# EasyEDA Pro project ESP32S3_DMX_RDM_2026-06-09.epro, board PCB_3
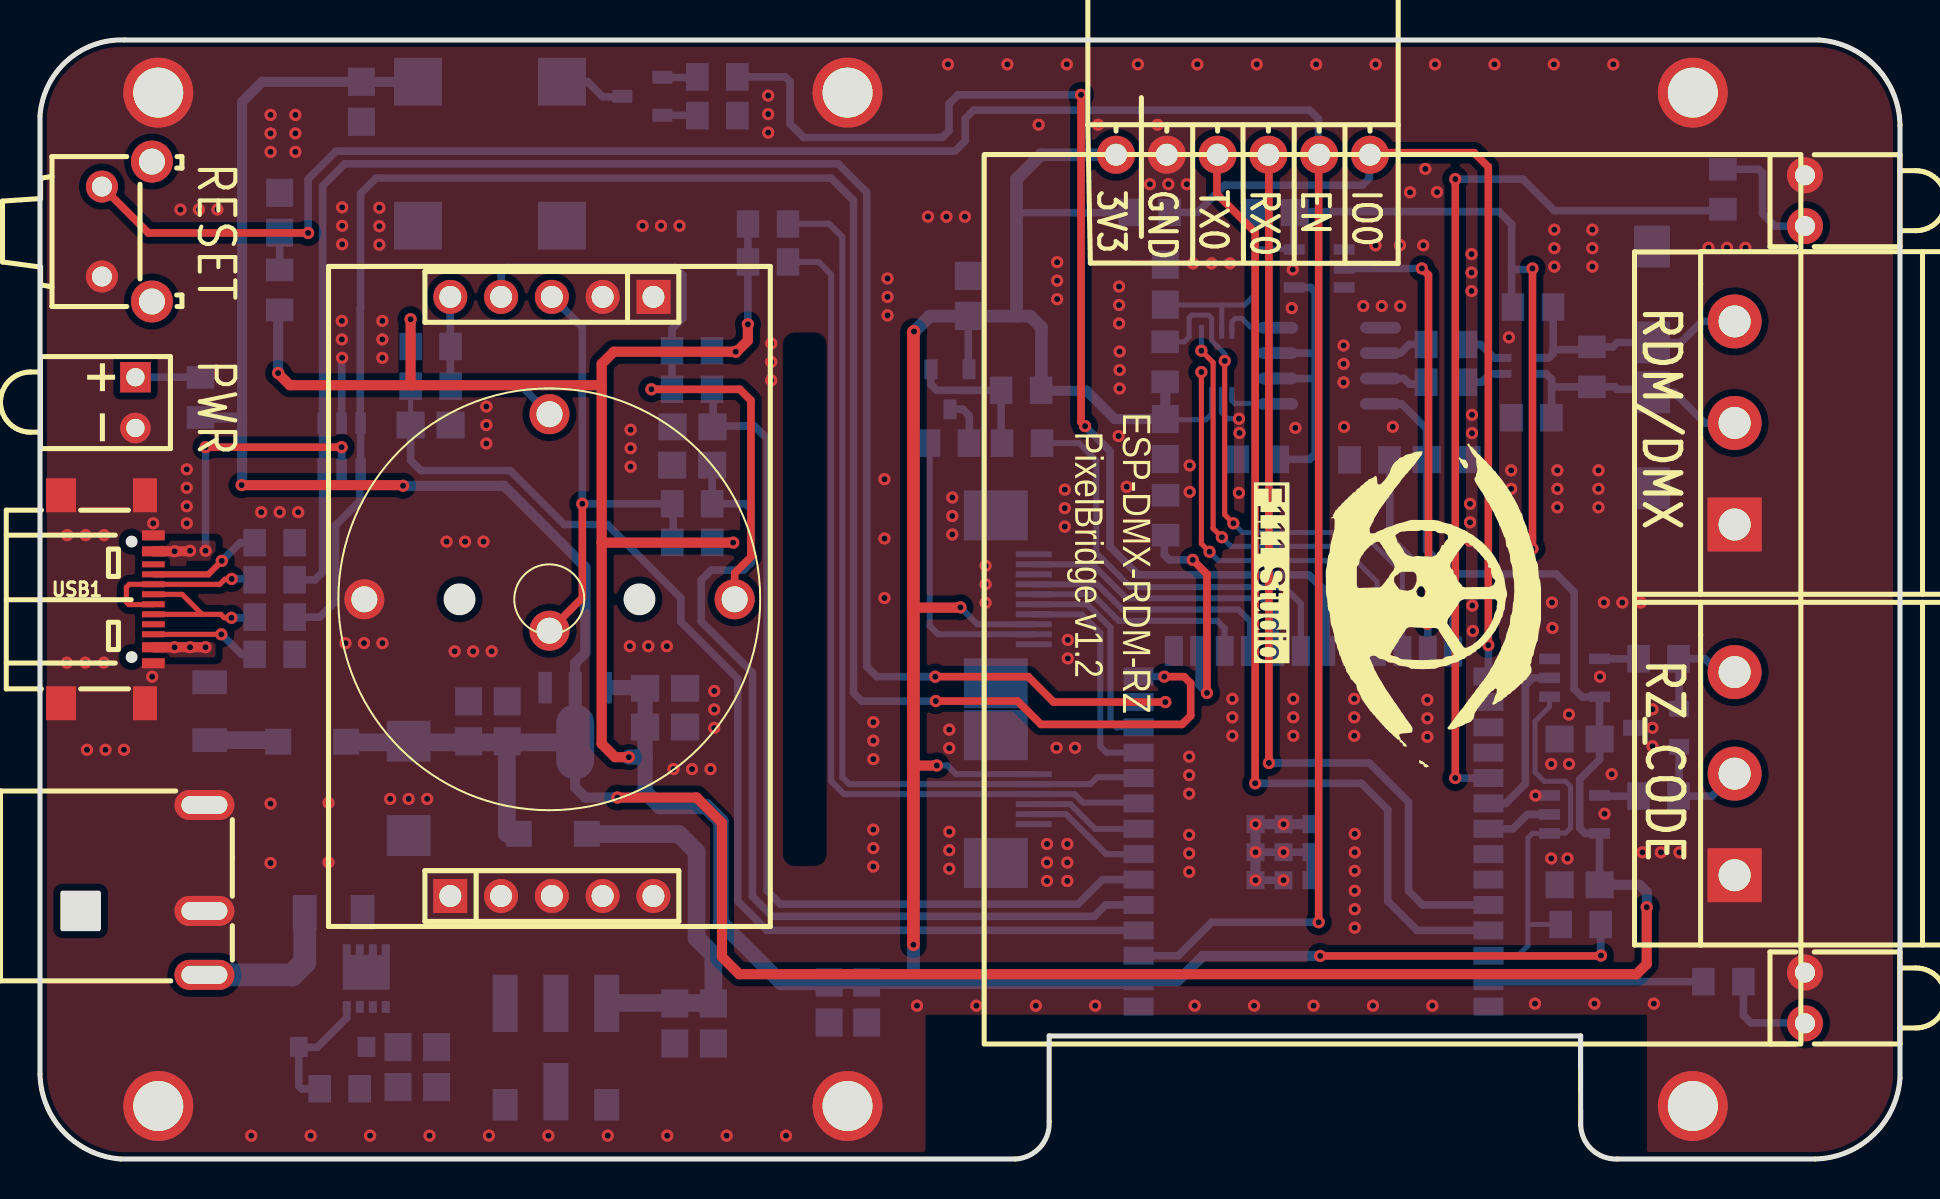
[diagram p17: board, top side]
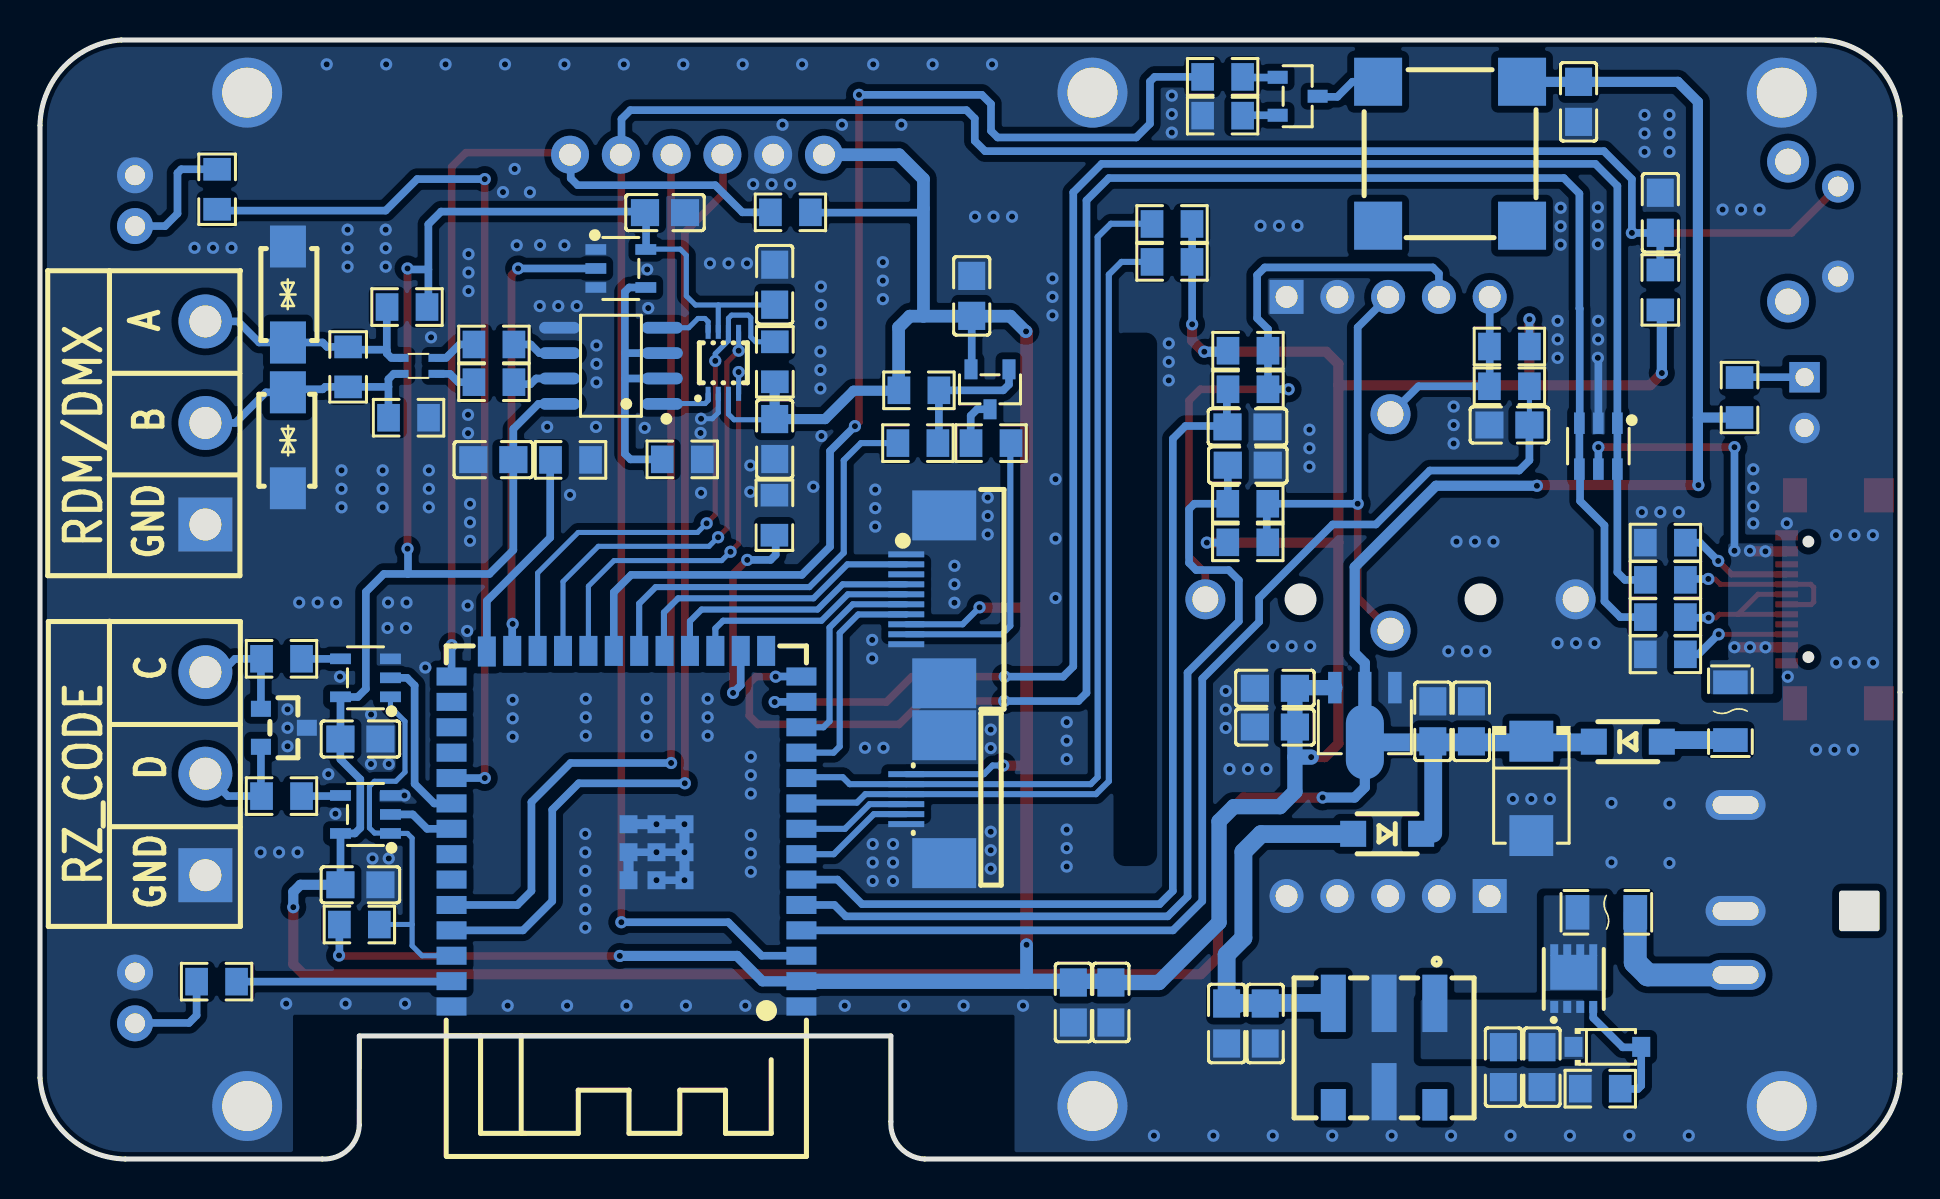
[diagram p18: board, bottom side, seen from below]

Outline 93.03 x 55.98 mm; copper layers: Top Layer, Bottom Layer. Coordinates in mm from the lower left corner of the outline.
Outline path: 0,52.17 0,23.35 0,4.27 arc(1.2,1.34) 4.06,0 48.79,0 arc(50.02,0.59) 50.48,1.87 50.48,6.16 77.06,6.16 77.06,1.69 arc(77.63,0.46) 78.91,0 88.76,0 arc(91.69,1.2) 93.03,4.06 93.03,51.71 arc(91.84,54.64) 88.97,55.98 4.22,55.98 arc(1.34,54.93) 0,52.17
Stack: Top Layer 0.035mm / Dielectric1 1.51mm FR4 er 4.5 / Bottom Layer 0.035mm

## Design rules (mm)
spacing copperThickness1oz (default): track to track 0.102, other pairs 0.152 to 0.3
spacing copperThickness2oz: track to track 0.203, other pairs 0.152 to 0.3
track width copperThickness1oz: min 0.127, default 0.254, max 2.54
track width copperThickness2oz (default): min 0.203, default 0.381, max 2.54
differential pair differentialPair (default): width min 0.127, default 0.254, max 2.54; gap min 0.152, default 0.152
net VBUS uses copperRegion2_copperThickness1oz
net GND uses copperRegion2_copperThickness1oz
pour e93 uses copperRegion2_default, default
net $2N68 uses copperRegion2_copperThickness1oz
net $2N66 uses copperRegion2_copperThickness1oz
net $1N437 uses copperRegion2_copperThickness1oz

## Placement (name value [footprint] x y rotation side)
C1  100nF  [C0805]  21.44 21.89 270 bottom
C2  22uF  [C0805]  23.37 21.89 270 bottom
C3  100nF  [C0805]  56.29 43.74 90 bottom
C4  100nF  [C0805]  61.77 47.35 0 bottom
C5  100nF  [C0805]  70.36 34.99 180 bottom
C6  100nF  [C0805]  41.35 7.83 90 bottom
C7  100nF  [C0805]  31.27 23.55 180 bottom
C8  100nF  [C0805]  56.29 36.02 90 bottom
C10  22uF  [C0805]  31.27 21.61 180 bottom
C11  10uF  [C0805]  39.47 7.83 90 bottom
C12  100nF  [C0805]  11.99 47.34 270 bottom
C13  100nF  [C0805]  77.01 13.72 0 bottom
C14  100nF  [C0805]  77.01 21.01 0 bottom
C20  10nF  [C0805]  32.64 36.63 0 bottom
C21  10nF  [C0805]  32.62 34.71 0 bottom
C22  10nF  [C0805]  19.54 36.72 180 bottom
C25  100nF  [C0805]  19.84 4.6 90 bottom
C26  10uF  [C0805]  17.91 4.6 270 bottom
C27  100nF  [C0805]  31.75 6.78 90 bottom
C28  22uF  [C0805]  33.68 6.78 90 bottom
C29  100nF  [C0805]  16.08 52.89 90 bottom
C32  22uF  [C0805]  46.43 43.18 270 bottom
CN1  WJ2EDGRC-5.08-03P-14-00A  [CONN-TH_3P-P5.08_WJ2EDGRC-5.08-3P]  84.76 19.28 90 top
CN2  WJ2EDGRC-5.08-03P-14-00A  [CONN-TH_3P-P5.08_WJ2EDGRC-5.08-3P]  84.76 36.82 90 top
D1  PESD5V0S2BT,215  [SOT-23_L2.9-W1.3-P1.90-LS2.4-BR]  80.83 21.57 0 bottom
D2  USBLC6-2SC6  [SOT-23-6_L2.9-W1.6-P0.95-LS2.8-BL]  15.09 35.66 0 bottom
D7  PMEG2020EH,115  [SOD-123FL_L2.6-W1.6-LS3.4-R-FD]  25.65 16.27 180 bottom
D8  PMEG2020EH,115  [SOD-123FL_L2.6-W1.6-LS3.4-R-FD]  13.61 20.88 0 bottom
D9  BZT52C15Q  [SOD-123_L2.6-W1.7-LS3.5-RD]  14.64 5.61 180 bottom
DC2  DC044  [DC-IN-TH_DC044]  8.22 13.46 0 top
F1  1206L050/36NR  [F1206]  8.48 22.4 90 bottom
F2  1206L050/36NR  [F1206]  14.69 12.34 0 bottom
FPC1  05B20L06P  [FPC-SMD_6P-P0.50_05B20L06P]  48.76 18 270 bottom
J1  -  [AN-P1S-2SP-Z]  34.75 28 180 top
L1  ACM2012-900-2P-T002  [IND-SMD_4P-L2.0-W1.2-TL]  74.1 39.68 0 bottom
LED2  MHK1375CGBTD  [LED-TH_MHK1375CGBTD]  88.28 8.06 90 top
LED3  MHK1375CGBTD  [LED-TH_MHK1375CGBTD]  88.28 47.94 90 top
LED4  MHK1375CRBTD  [LED-TH_MHK1375CRBTD]  4.77 37.84 270 top
NOREF  -  [Pad_e365]  40.39 2.65 0 top
NOREF#2  -  [Pad_e379]  82.67 2.65 0 top
NOREF#3  -  [Pad_e378]  82.67 53.35 0 top
NOREF#4  -  [Pad_e295]  5.92 2.65 0 top
NOREF#5  -  [Pad_e294]  40.39 53.35 0 top
NOREF#6  -  [Pad_e380]  5.92 53.35 0 top
Q4  HSBB6115  [DFN-8_L3.0-W3.0-P0.65-BL-1]  16.32 9.03 180 bottom
Q5  S8050  [SOT-23-3_L2.9-W1.3-P1.90-LS2.4-BR]  30.13 53.17 0 bottom
Q6  AO3401A  [SOT-23-3_L2.9-W1.3-P1.90-LS2.4-BR]  45.52 38.51 90 bottom
R1  10kΩ  [R0805]  11.99 43.48 270 bottom
R2  10kΩ  [R0805]  55.5 47.36 180 bottom
R4  5.1kΩ  [R0805]  11.73 30.84 0 bottom
R5  5.1kΩ  [R0805]  11.73 25.25 0 bottom
R6  1kΩ  [R0805]  8.03 38.09 270 bottom
R7  470Ω  [R0805]  84.18 48.51 270 bottom
R8  470Ω  [R0805]  84.2 8.87 180 bottom
R9  0Ω  [R0805]  70.33 40.75 180 bottom
R10  0Ω  [R0805]  70.33 38.86 180 bottom
R11  33R  [R0805]  80.95 18.16 180 bottom
R12  120R  [R0805]  77.62 39.63 270 bottom
R13  33R  [R0805]  80.95 25.02 180 bottom
R14  10kΩ  [R0805]  77.06 11.73 0 bottom
R15  10kΩ  [R0805]  60.91 35 180 bottom
R16  10kΩ  [R0805]  56.28 39.88 270 bottom
R17  1kΩ  [R0805]  74.6 37.08 180 bottom
R18  1kΩ  [R0805]  74.68 42.62 0 bottom
R20  0Ω  [R0805]  11.73 28.97 0 bottom
R21  100Ω  [R0805]  32.61 38.51 180 bottom
R22  100Ω  [R0805]  32.62 32.78 0 bottom
R23  100Ω  [R0805]  19.54 38.66 0 bottom
R24  1kΩ  [R0805]  33.88 54.14 180 bottom
R39  100kΩ  [R0805]  14.99 3.52 180 bottom
R40  4.7kΩ  [R0805]  32.61 40.44 0 bottom
R41  4.7kΩ  [R0805]  32.62 30.85 0 bottom
R42  4.7kΩ  [R0805]  19.54 40.65 180 bottom
R44  100Ω  [R0805]  33.88 52.2 180 bottom
R45  100Ω  [R0805]  49.12 35.81 180 bottom
R47  0Ω  [R0805]  11.73 27.11 180 bottom
R48  4.7kΩ  [R0805]  36.41 46.78 180 bottom
R49  4.7kΩ  [R0805]  36.41 44.88 180 bottom
R50  10kΩ  [R0805]  56.3 32.21 270 bottom
R51  10kΩ  [R0805]  66.5 34.97 0 bottom
R52  100kΩ  [R0805]  49.07 38.46 0 bottom
R53  33Ω  [R0805]  45.47 35.81 0 bottom
SW1  KH-6X6X5H-ZJ  [SW-TH_KH-6X6X5H-ZJ]  4.35 46.4 270 top
TVS1  SMBJ5.0A  [SMB_L4.6-W3.6-LS5.3-RD]  18.44 18.54 270 bottom
U1  2.4GHz  [WIRELM-SMD_ESP32-S3-WROOM-1]  63.7 16.52 0 bottom
U2  THVD1450DR  [SOIC-8_L4.9-W3.9-P1.27-LS6.0-BL]  64.48 39.68 90 bottom
U3  TXS0102DCUR  [VSON8_L2.0-W2.3-P0.50-LS3.1-BL]  58.85 39.83 180 bottom
U4  AP7365-33YRG-13  [SOT-89-3_L4.5-W2.5-P1.50-LS4.2-BR]  26.77 22.23 90 bottom
U6  DS1024-1x6R2  [HDR-TH_6P-P2.54-H-F-W10.0-N]  60.17 50.24 180 top
U10  2.731kHz  [BUZ-SMD_4P-L8.5-W8.5-P8.50-TL-A]  22.5 50.29 270 bottom
U11  2541WV-05P  [HDR-TH_5P-P2.54-V-M]  25.6 13.16 0 top
U12  2541WV-05P  [HDR-TH_5P-P2.54-V-M]  25.6 43.13 180 top
U13  SMAJ12CA  [SMA_L4.3-W2.7-LS5.1-BI]  80.63 43.25 270 bottom
U14  SMAJ12CA  [SMA_L4.3-W2.7-LS5.1-BI]  80.63 35.95 90 bottom
U17  K7805MT-1000R4  [PWRM-SMD_K78XXMT-1000R4]  25.81 5.25 0 bottom
U18  SN74AHCT1G125DBVR(UMW)  [SOT-23-5_L3.0-W1.5-P0.95-LS2.8-BL]  76.75 17.24 90 bottom
U19  SN74AHCT1G125DBVR(UMW)  [SOT-23-5_L3.0-W1.5-P0.95-LS2.8-BL]  76.75 24.07 90 bottom
U20  SN74AHCT1G125DBVR(UMW)  [SOT-23-5_L3.0-W1.5-P0.95-LS2.8-BL]  63.98 44.55 270 bottom
U21  HC-FPC-0.5-10P-CSH20  [FPC-SMD_10P-P0.50_HC-FPC-0.5-10P-CSH20]  48.76 28 90 bottom
USB1  TYPE-C 16P QTWT  [USB-TYPE-C-SMD_TYPE-C-16P-QTWT]  3.36 28 270 top

## Footprints (pads in the part's own frame, mm; a bottom-side part is the same pattern mirrored in y, then rotated)
AN-P1S-2SP-Z
  round 2 hole 1.3: A(0,0) B(9.26,-9.26) COM(18.52,0) N0(9.26,1.57)
BUZ-SMD_4P-L8.5-W8.5-P8.50-TL-A
  rect 2.4x2.4 smd: 1(-3.6,3.6) 2(-3.6,-3.6) 3(3.599,-3.599) 4(3.6,3.6)
C0805
  rect 1.41x1.35 smd: 1(-1,0) 2(1,0)
CONN-TH_3P-P5.08_WJ2EDGRC-5.08-3P
  rect 2.7x2.7 hole 1.6: 1(-5.08,0)
  round 2.7 hole 1.6: 2(0,0) 3(5.08,0)
DC-IN-TH_DC044
  oval 3x1.5 hole 2.3x0.9: 2(0,4.25) 3(0,-1.05) 4(0,-4.25)
DFN-8_L3.0-W3.0-P0.65-BL-1
  rect 0.4x0.6 smd: 1(-0.975,-1.419) 2(-0.325,-1.419) 3(0.325,-1.419) 4(0.975,-1.419) 5(-0.975,1.419) 5(-0.325,1.419) 5(0.325,1.419) 5(0.975,1.419)
  rect 2.35x1.75 smd: 5(0,0.315)
F1206
  rect 1.19x1.728 smd: 1(-1.445,0) 2(1.445,0)
FPC-SMD_6P-P0.50_05B20L06P
  rect 0.3x1.8 smd: 1(-1.25,-0.95) 2(-0.75,-0.95) 3(-0.25,-0.95) 4(0.25,-0.95) 5(0.75,-0.95) 6(1.25,-0.95)
  rect 2.5x3.2 smd: 7(-3.2,0.95) 8(3.2,0.95)
FPC-SMD_10P-P0.50_HC-FPC-0.5-10P-CSH20
  rect 0.3x1.8 smd: 1(2.25,0.95) 2(1.75,0.95) 3(1.25,0.95) 4(0.75,0.95) 5(0.25,0.95) 6(-0.25,0.95) 7(-0.75,0.95) 8(-1.25,0.95) 9(-1.75,0.95) 10(-2.25,0.95)
  rect 2.5x3.2 smd: 11(-4.2,-0.95) 12(4.2,-0.95)
HDR-TH_5P-P2.54-V-M
  rect 1.7x1.7 hole 1.1: 1(-5.08,0)
  round 1.7 hole 1.1: 2(-2.54,0) 3(0,0) 4(2.54,0) 5(5.08,0)
HDR-TH_6P-P2.54-H-F-W10.0-N
  round 1.9 hole 1.1: 1(-6.35,0) 2(-3.81,0) 3(-1.27,0) 4(1.27,0) 5(3.81,0) 6(6.35,0)
IND-SMD_4P-L2.0-W1.2-TL
  rect 0.8x0.4 smd: 1(-0.901,0.399) 2(-0.899,-0.4) 3(0.9,-0.401) 4(0.901,0.401)
LED-TH_MHK1375CGBTD
  round 1.8 hole 1: 1(-1.27,0) 2(1.27,0)
LED-TH_MHK1375CRBTD
  rect 1.524x1.524 hole 0.914: 1(-1.27,0)
  round 1.524 hole 0.914: 2(1.27,0)
Pad_e294
  round 3.5 hole 2.5: 1(0,0)
Pad_e295
  round 3.5 hole 2.5: 1(0,0)
Pad_e365
  round 3.5 hole 2.5: 1(0,0)
Pad_e378
  round 3.5 hole 2.5: 1(0,0)
Pad_e379
  round 3.5 hole 2.5: 1(0,0)
Pad_e380
  round 3.5 hole 2.5: 1(0,0)
PWRM-SMD_K78XXMT-1000R4
  rect 1.25x2.87 smd: 1(-2.54,-2.538) 2(0,-2.538) 3(2.54,-2.538) 5(0,1.883)
  rect 1.25x1.58 smd: 4(2.54,2.538) 6(-2.54,2.538)
R0805
  rect 1.133x1.377 smd: 1(-1,0) 2(1,0)
SMA_L4.3-W2.7-LS5.1-BI
  rect 2.1x1.8 smd: 1(-2.4,0) 2(2.4,0)
SMB_L4.6-W3.6-LS5.3-RD
  rect 2.047x2.192 smd: 1(-2.361,0) 2(2.361,0)
SOD-123_L2.6-W1.7-LS3.5-RD
  rect 0.9x1 smd: 1(-1.692,0) 2(1.692,0)
SOD-123FL_L2.6-W1.6-LS3.4-R-FD
  rect 1.3x1.3 smd: 1(1.7,0) 2(-1.7,0)
SOIC-8_L4.9-W3.9-P1.27-LS6.0-BL
  oval 0.588x2.045 smd: 1(-1.905,-2.57) 2(-0.635,-2.57) 3(0.635,-2.57) 4(1.905,-2.57) 5(1.905,2.57) 6(0.635,2.57) 7(-0.635,2.57) 8(-1.905,2.57)
SOT-23-3_L2.9-W1.3-P1.90-LS2.4-BR
  rect 1x0.65 smd: 1(1,-0.95) 2(1,0.95) 3(-1,0)
SOT-23-5_L3.0-W1.5-P0.95-LS2.8-BL
  rect 0.532x1.045 smd: 1(-0.95,-1.25) 2(0,-1.25) 3(0.95,-1.25) 4(0.95,1.25) 5(-0.95,1.25)
SOT-23-6_L2.9-W1.6-P0.95-LS2.8-BL
  rect 0.532x1.072 smd: 1(-0.95,-1.149) 2(0,-1.149) 3(0.95,-1.149) 4(0.95,1.149) 5(0,1.149) 6(-0.95,1.149)
SOT-23_L2.9-W1.3-P1.90-LS2.4-BR
  rect 1x0.8 smd: 1(1.15,-0.95) 2(1.15,0.95) 3(-1.15,0)
SOT-89-3_L4.5-W2.5-P1.50-LS4.2-BR
  rect 1.575x0.672 smd: 1(1.356,-1.5) 3(1.356,1.5)
  custom 5.377x1.9 smd: 2(-1.356,0)
SW-TH_KH-6X6X5H-ZJ
  round 1.6 hole 1: 1(-2.25,-1.25) 2(2.25,-1.25)
  round 2.1 hole 1.3: 3(-3.5,1.25) 4(3.5,1.25)
USB-TYPE-C-SMD_TYPE-C-16P-QTWT
  rect 1.7x1.2 smd: 0(-5.2,1.891) 0(5.2,1.891)
  rect 1.7x1.5 smd: 0(-5.2,-2.309) 0(5.2,-2.309)
  rect 0.5x1.14 smd: A1(-3.2,2.308) A4(-2.4,2.308) A9(2.4,2.308) A12(3.2,2.308)
  rect 0.3x1.14 smd: A5(-1.25,2.308) A6(-0.25,2.308) A7(0.25,2.308) A8(1.25,2.309) B5(1.75,2.308) B6(0.75,2.308) B7(-0.75,2.308) B8(-1.75,2.309)
VSON8_L2.0-W2.3-P0.50-LS3.1-BL
  rect 0.25x0.7 smd: 1(-0.762,-1.55) 2(-0.254,-1.55) 3(0.254,-1.55) 4(0.762,-1.55) 5(0.762,1.55) 6(0.254,1.55) 7(-0.254,1.55) 8(-0.762,1.55)
WIRELM-SMD_ESP32-S3-WROOM-1
  rect 1.5x0.9 smd: 1(-8.75,8.895) 2(-8.75,7.625) 3(-8.75,6.355) 4(-8.75,5.085) 5(-8.75,3.815) 6(-8.75,2.545) 7(-8.75,1.275) 8(-8.75,0.005) 9(-8.75,-1.265) 10(-8.75,-2.535) 11(-8.75,-3.805) 12(-8.75,-5.075) 13(-8.75,-6.345) 14(-8.75,-7.615) 27(8.75,-7.615) 28(8.75,-6.345) 29(8.75,-5.075) 30(8.75,-3.805) 31(8.75,-2.535) 32(8.75,-1.265) 33(8.75,0.005) 34(8.75,1.275) 35(8.75,2.545) 36(8.75,3.815) 37(8.75,5.085) 38(8.75,6.355) 39(8.75,7.625) 40(8.75,8.895)
  rect 0.9x1.5 smd: 15(-6.985,-8.895) 16(-5.715,-8.895) 17(-4.445,-8.895) 18(-3.175,-8.895) 19(-1.905,-8.895) 20(-0.635,-8.895) 21(0.635,-8.895) 22(1.905,-8.895) 23(3.175,-8.895) 24(4.445,-8.895) 25(5.715,-8.895) 26(6.985,-8.865)
  rect 0.9x0.9 smd: 41(-2.9,-0.225) 41(-2.9,1.175) 41(-2.9,2.575) 41(-1.5,-0.225) 41(-1.5,1.175) 41(-1.5,2.575) 41(-0.1,-0.225) 41(-0.1,1.175) 41(-0.1,2.575)

## Nets
+3.3V: C6.2 C7.2 C8.2 C10.2 C11.2 C32.2 FPC1.1 Q6.2 R1.2 R2.2 R14.2 R16.2 R40.2 R41.2 R42.2 R48.2 R49.2 R52.2 U1.2 U3.3 U4.3 U6.6 U21.8
+5V: C1.2 C2.2 C3.1 C4.2 C5.2 C13.2 C14.2 C29.2 D7.1 D8.1 R6.2 R18.1 TVS1.1 U2.8 U3.7 U4.2 U10.1 U18.5 U19.5 U20.5
GND: C1.1 C2.1 C3.2 C4.1 C5.1 C6.1 C7.1 C8.1 C10.1 C11.1 C12.1 C13.1 C14.1 C20.1 C21.1 C22.1 C25.1 C26.2 C27.1 C28.1 C29.1 C32.1 CN1.1 CN2.1 D1.3 D2.2 DC2.2 DC2.3 FPC1.6 FPC1.7 FPC1.8 J1.COM LED2.2 LED3.2 LED4.2 NOREF.1 NOREF#2.1 NOREF#3.1 NOREF#4.1 NOREF#5.1 NOREF#6.1 R4.2 R5.2 R15.2 R17.2 R39.1 R44.1 R50.1 R51.1 SW1.2 TVS1.2 U1.1 U1.40 U1.41 U2.5 U3.2 U4.1 U6.5 U11.1 U11.2 U11.3 U11.4 U11.5 U12.1 U12.2 U13.1 U14.1 U17.2 U17.5 U18.3 U19.3 U20.1 U20.3 U21.1 U21.10 U21.11 U21.12 USB1.0 USB1.A1 USB1.A12
VBUS: D2.5 F1.2 USB1.A4 USB1.A9
VCC_24V: DC2.4 F2.1
A: J1.A R21.2 R40.1 U12.4
B: J1.B R23.2 R42.1 U12.5
BEEP: R24.1 U1.21
CTP_INT: FPC1.4 U1.8
CTP_RST: FPC1.5 U1.7
CTP_SCL: FPC1.3 R49.1 U1.9
CTP_SDA: FPC1.2 R48.1 U1.10
DMX_EN: U1.25 U20.2
DMX_OE: R16.1 U1.24 U3.6
DMX_RX: U1.22 U3.4
DMX_TX: U1.23 U3.5
DN: R20.1 USB1.A7 USB1.B7
DP: R47.2 USB1.A6 USB1.B6
EN: C12.2 R1.1 SW1.1 U1.3 U6.2
ENCODER_A: C20.2 R21.1 U1.6
ENCODER_B: C22.2 R23.1 U1.4
ENCODER_KEY: C21.2 R22.2 U1.5
IO0: R2.1 U1.27 U6.1
IO41: U1.34
IO42: U1.35
KEY: J1.N0 R22.1 R41.1 U12.3
LCD_A: R53.1 U21.9
LCD_BL: R45.1 U1.20
LCD_CS: U1.17 U21.5
LCD_RS: U1.11 U21.7
LCD_RST: U1.12 U21.6
LCD_SCL: U1.18 U21.4
LCD_SDA: U1.19 U21.2
LED2: R8.2 U1.39
LED3: R7.2 U1.31
RXD0: U1.36 U6.3
RZ_CLK: U1.32 U19.2
RZ_DATA: U1.33 U18.2
RZ_OE: R14.1 U1.38 U18.1 U19.1
TXD0: U1.37 U6.4
USB_DN: D2.1 D2.6 R20.2 U1.13
USB_DP: D2.3 D2.4 R47.1 U1.14
$1N288: R15.1 U2.2 U2.3 U20.4
$1N299: R11.2 U18.4
$1N306: U2.1 U3.1
$1N311: U2.4 U3.8
$1N321: CN1.2 D1.2 R11.1
$1N328: R13.2 U19.4
$1N333: CN1.3 D1.1 R13.1
$1N357: R10.2 U2.7
$1N358: R9.2 U2.6
$1N435: LED4.1 R6.1
$1N437: D8.2 F1.1
$1N442: L1.1 R10.1
$1N443: L1.2 R9.1
$1N447: LED2.1 R8.1
$1N449: LED3.1 R7.1
$1N474: CN2.2 L1.4 R12.2 R17.1 U14.2
$1N476: CN2.3 L1.3 R12.1 R18.2 U13.2
$1N486: R5.1 USB1.B5
$1N487: R4.1 USB1.A5
$1N493: R51.2 U1.26
$1N494: R50.2 U1.16
$2N13: D9.2 Q4.4 R39.2
$2N41: C27.2 C28.2 D7.2 U17.3
$2N58: Q5.3 U10.2
$2N66: C25.2 C26.1 D9.1 Q4.1 Q4.2 Q4.3 U17.1
$2N68: F2.2 Q4.5
$2N72: Q5.1 R24.2
$2N73: Q5.2 R44.2
$2N96: U21.3
$2N112: Q6.3 R53.2
$2N131: Q6.1 R45.2 R52.1

Pads without a net: SW1 3 4; U1 15 28 29 30; U10 3 4; U17 4 6; USB1 A8 B8

## Via types
v1: diameter 0.61, hole 0.305, Top Layer to Bottom Layer, 332 vias

## Routing (per net, layer and track width the routed paths; a pad name or vN(x,y) marks a point on that pad's centre or on a via; arc(x,y) is an arc through that point)
+3.3V: length 220
  Top Layer w0.381: v1(64.03,10.16) 78.06,10.16 v1(78.08,10.18)
  Top Layer w0.508: 28.09,38.71 28.09,30.84 ; 28.09,38.71 18.57,38.71 ; 28.09,38.71 28.09,39.78 28.7,40.39 v1(34.8,40.39) 34.85,40.39 35.41,40.94 v1(35.41,41.76) ; 28.09,30.84 28.09,20.78 28.76,20.11 v1(29.45,20.11) ; 28.09,30.84 v1(34.67,30.84) ; 18.57,38.71 12.5,38.71 11.91,39.29 v1(11.91,39.32) ; 18.57,38.71 18.54,38.74 v1(18.54,42.01) ; v1(44.86,19.69) 43.69,19.69 ; 43.69,27.59 46.03,27.59 v1(46.04,27.6)
  Top Layer w0.635: v1(43.71,41.4) 43.69,41.38 v1(43.69,10.72)
  Bottom Layer w0.254: C8.2 56.32,36.98 58.32,36.98 58.6,37.26 U3.3
  Bottom Layer w0.305: FPC1.1 45.82,19.25 45.39,19.69 v1(44.86,19.69) ; v1(46.04,27.6) 46.89,26.75 U21.8
  Bottom Layer w0.381: v1(78.08,10.18) 78.06,10.2 R14.2 ; 46.47,39.51 46.43,39.54 C32.2 ; R42.2 v1(18.54,42.01) ; R2.2 54.49,47.35 49.05,47.35 48.85,47.55 ; 35.41,44.87 35.41,46.77 R48.2 ; 35.41,44.87 R49.2 ; 35.41,44.87 v1(35.41,41.76) ; 33.75,30.84 v1(34.67,30.84)
  Bottom Layer w0.508: R16.2 56.29,38.88 C8.2 53.76,37.02 52.34,38.43 50.07,38.43 50.07,38.51 ; v1(64.03,10.16) 58.17,10.16 56.9,8.89 54.94,8.89 ; 34.83,40.39 33.61,40.39 ; R1.2 11.91,42.4 v1(11.91,39.32)
  Bottom Layer w0.635: 43.69,8.89 v1(43.69,10.72) ; v1(43.71,41.4) 43.74,41.4 44.5,42.16 48.85,42.16 ; 48.85,42.16 48.85,49.02 50.06,50.24 U6.6 ; 48.85,42.16 49.53,42.16 50.09,41.61 50.09,38.52 50.07,38.51
  Bottom Layer w0.762: U4.3 30.23,23.58 C7.2 C10.2 30.27,20.11 ; 30.27,20.11 v1(29.45,20.11) ; 30.27,20.11 30.27,18.38 31.01,17.63 33.32,17.63 34.06,16.89 34.06,11.84 37.07,8.83 C11.2 ; 39.66,8.89 54.94,8.89
+5V: length 222.5
  Top Layer w0.381: v1(74.65,30.53) v1(74.65,44.55)
  Top Layer w0.508: v1(28.88,18.08) 32.84,18.08 34.11,16.81 34.11,10.11 34.98,9.25 79.86,9.25 80.37,9.75 v1(80.37,12.6) ; v1(10.08,33.71) 18.13,33.71 v1(18.16,33.68)
  Bottom Layer w0.254: 62.72,45.52 U20.5 ; C3.1 56.3,42.72 59.11,42.72 ; 62.72,45.52 61.01,45.52 60.71,45.21 60.71,43.18 60.25,42.72 59.11,42.72 ; 59.11,42.72 U3.7
  Bottom Layer w0.381: U2.8 68.1,37.78 69.36,36.52 C5.2 69.36,30.46 70.55,29.27 74.63,29.27 ; 62.7,47.35 62.7,47.02 62.72,47 62.72,45.52 ; 73.61,44.5 73.61,46.76 72.97,47.4 62.82,47.4 C4.2 ; 73.61,44.5 73.61,42.67 73.62,42.67 R18.1 ; 73.61,44.5 74.6,44.5 v1(74.65,44.55) ; v1(74.65,30.53) 74.63,30.51 74.63,29.27 ; 74.63,29.27 75.84,29.27 76.73,28.37 76.73,23.52 77.14,23.11 78,23.11 U19.5 78,21.02 C14.2 78.01,20 77.01,19 77.01,16.56 77.29,16.29 U18.5 78,13.72 77.7,13.72
  Bottom Layer w0.508: v1(10.08,33.71) 10.11,33.74 10.11,37.09 ; U10.1 18.9,53.89 C29.2 11.11,53.89 10.11,52.88 10.11,37.09 ; C13.2 80.01,13.72 80.37,13.36 v1(80.37,12.6) ; 10.11,37.09 R6.2 ; v1(18.16,33.68) 23.21,33.68 27.28,29.61 27.28,25.32 26.77,24.81 U4.2 26.77,18.6 27.28,18.08 v1(28.88,18.08)
  Bottom Layer w0.889: 23.32,20.84 23.35,20.81 23.35,16.28 ; 23.32,20.84 18.5,20.84 ; 23.32,20.84 26.74,20.84 U4.2 ; 18.5,20.84 15.35,20.84 D8.1 ; 18.5,20.84 TVS1.1
GND: length 16.4
  Bottom Layer w0.254: v1(59.97,37.03) 59.41,37.03 59.11,37.34 U3.2
  Bottom Layer w0.381: v1(60.8,13.95) v1(62.2,13.95) ; v1(15.11,40.08) 15.09,40.06 D2.2 ; U1.41 v1(62.2,15.35) v1(60.8,15.35)
  Bottom Layer w0.508: U1.41 v1(62.2,16.75) v1(60.8,16.75) v1(60.8,15.35) v1(60.8,13.95) ; U1.41 U1.41
  vias: v1(1.35,24.83) v1(1.36,31.21) v1(2.28,31.21) v1(2.27,24.83) v1(2.35,20.47) v1(3.21,31.21) v1(3.19,24.83) v1(3.28,20.47) v1(4.2,20.47) v1(5.61,24.13) v1(5.66,31.8) v1(7.03,47.5) v1(7.34,34.5) v1(7.34,33.58) v1(7.34,32.65) v1(7.34,31.8) v1(7.95,47.5) v1(8.87,47.5) v1(10.57,1.17) v1(11.06,32.36) v1(11.53,52.23) v1(11.53,51.31) v1(11.53,50.38) v1(11.53,17.78) v1(11.53,14.81) v1(11.99,32.36) v1(12.78,52.23) v1(12.78,51.31) v1(12.78,50.38) v1(12.91,32.36) v1(13.54,1.17) v1(14.43,17.81) v1(14.43,14.84) v1(15.11,47.61) v1(15.11,46.69) v1(15.11,45.76) v1(15.1,41.93) v1(15.1,41) v1(15.28,25.81) v1(16.2,25.81) v1(16.51,1.17) v1(16.97,47.59) v1(16.97,46.67) v1(16.97,45.74) v1(17.12,41.93) v1(17.12,41) v1(17.12,40.08) v1(17.13,25.81) v1(17.52,18.01) v1(18.44,18.01) v1(19.36,18.01) v1(19.48,1.17) v1(20.34,30.89) v1(20.74,25.4) v1(21.26,30.89) v1(21.67,25.4) v1(22.18,30.89) v1(22.33,37.64) v1(22.33,36.72) v1(22.33,35.79) v1(22.46,1.17) v1(22.59,25.4) v1(25.43,1.17) v1(28.4,1.17) v1(29.54,36.48) v1(29.54,35.56) v1(29.54,34.64) v1(29.5,25.65) v1(30.14,46.69) v1(30.43,25.65) v1(31.06,46.69) v1(31.35,25.65) v1(31.37,1.17) v1(31.69,19.51) v1(31.99,46.69) v1(32.61,19.51) v1(33.54,19.51) v1(33.72,23.42) v1(33.72,22.49) v1(33.72,21.57) v1(34.34,1.17) v1(36.42,53.2) v1(36.42,52.27) v1(36.42,51.35) v1(36.58,40.8) v1(36.58,39.88) v1(36.58,38.95) v1(37.32,1.17) v1(41.68,21.85) v1(41.68,20.93) v1(41.68,20) v1(41.68,16.48) v1(41.68,15.56) v1(41.68,14.63) v1(42.24,34.01) v1(42.24,31.04) v1(42.24,28.07) v1(42.39,44.05) v1(42.39,43.13) v1(42.39,42.2) v1(43.87,7.67) v1(44.41,47.14) v1(45.34,47.14) v1(45.41,54.76) v1(45.48,21.48) v1(45.48,20.56) v1(45.48,16.37) v1(45.48,15.45) v1(45.48,14.52) v1(45.63,33.09) v1(45.63,32.17) v1(45.63,31.24) v1(46.26,47.14) v1(46.84,7.67) v1(47.29,29.68) v1(47.29,28.75) v1(47.29,27.83) v1(48.39,54.76) v1(49.81,7.67) v1(49.95,51.74) v1(50.37,15.76) v1(50.37,14.83) v1(50.37,13.91) v1(50.85,20.57) v1(50.88,44.87) v1(50.88,43.94) v1(50.88,43.02) v1(51.26,33.49) v1(51.26,32.56) v1(51.26,31.64) v1(51.36,54.76) v1(51.41,25.97) v1(51.41,25.04) v1(51.38,15.76) v1(51.38,14.83) v1(51.38,13.91) v1(51.77,20.57) v1(52.78,7.67) v1(52.92,51.74) v1(53.95,36.17) v1(53.97,43.65) v1(53.97,42.72) v1(53.97,41.8) v1(54,40.4) v1(54,39.47) v1(54,38.55) v1(54.36,33.63) v1(54.91,54.76) v1(55.51,48.77) v1(55.9,51.74) v1(56.44,48.77) v1(57.36,48.77) v1(57.51,34.7) v1(57.51,33.38) v1(57.48,20.13) v1(57.48,19.2) v1(57.48,18.28) v1(57.48,16.22) v1(57.48,15.29) v1(57.48,14.37) v1(57.67,44.81) v1(57.75,7.67) v1(57.89,54.76) v1(58.6,44.81) v1(59.52,44.81) v1(59.64,23.02) v1(59.64,22.1) v1(59.64,21.17) v1(60,36.32) v1(59.97,33.33) v1(60.73,7.67) v1(60.86,54.76) v1(62.61,42.57) v1(62.66,44.5) v1(62.69,23.02) v1(62.69,22.1) v1(62.69,21.17) v1(62.79,36.58) v1(63.7,7.67) v1(63.83,54.76) v1(65.2,40.7) v1(65.2,39.78) v1(65.2,38.85) v1(65.23,36.63) v1(65.74,23.02) v1(65.74,22.1) v1(65.74,21.17) v1(65.76,16.27) v1(65.76,15.34) v1(65.76,14.42) v1(65.76,13.42) v1(65.76,12.5) v1(65.76,11.57) v1(66.19,42.67) v1(66.52,33.22) v1(66.67,7.67) v1(66.8,54.76) v1(66.8,45.71) v1(67.11,42.67) v1(67.67,36.63) v1(68.02,45.72) v1(68.04,42.67) v1(68.53,48.36) v1(69.19,45.71) v1(69.29,49.53) v1(69.39,22.97) v1(69.39,22.05) v1(69.39,21.12) v1(69.64,7.67) v1(69.78,54.76) v1(69.88,48.37) v1(71.53,32.78) v1(71.53,31.85) v1(71.53,30.93) v1(71.6,45.27) v1(71.6,44.35) v1(71.6,43.42) v1(71.62,37.23) v1(71.62,36.31) v1(71.64,27.69) v1(71.67,26.42) v1(72.75,54.76) v1(73.47,41.11) v1(73.58,34.45) v1(73.58,33.53) v1(73.58,32.6) v1(73.76,24.59) v1(74.7,27.84) v1(74.73,26.57) v1(74.8,18.19) v1(74.78,7.77) v1(75.63,27.84) v1(75.59,19.76) v1(75.59,15.04) v1(75.72,54.76) v1(75.74,46.49) v1(75.74,45.57) v1(75.74,44.64) v1(75.65,26.57) v1(75.9,34.45) v1(75.9,33.53) v1(75.9,32.6) v1(76.4,15.04) v1(76.47,22.24) v1(76.48,19.76) v1(77.65,46.49) v1(77.65,45.57) v1(77.65,44.64) v1(77.75,7.77) v1(77.95,34.45) v1(77.95,33.53) v1(77.95,32.6) v1(78.03,24.13) v1(78.22,27.84) v1(78.26,17.27) v1(78.61,19.25) v1(78.69,54.76) v1(79.15,27.84) v1(80.07,27.84) v1(80.15,15.34) v1(80.65,22.5) v1(80.65,21.57) v1(80.65,20.65) v1(80.72,7.77) v1(81.08,15.34) v1(82,15.34) v1(83.46,45.58) v1(84.38,45.58) v1(85.3,45.58)
VBUS: length 17.5
  Top Layer w0.381: v1(15.09,35.61) v1(8.28,35.61)
  Top Layer w0.508: v1(8.28,25.6) 8.28,25.6 USB1.A9 ; USB1.A4 v1(6.73,30.4) 7.52,30.4
  Bottom Layer w0.381: v1(8.28,30.43) v1(8.28,35.61) ; D2.5 v1(15.09,35.61)
  vias: v1(6.73,25.6) v1(7.51,30.43) v1(7.51,25.6)
VCC_24V: length 7.8
  Bottom Layer w1.143: F2.1 13.24,9.84 12.62,9.21 DC2.4
A: length 33
  Top Layer w0.381: v1(30.58,38.51) 35,38.51 35.56,37.95 35.56,30.12 34.75,29.31 J1.A
  Bottom Layer w0.381: 23.06,43.13 23.06,44.3 23.37,44.6 31.78,44.6 32.16,44.22 32.16,42.06 31.61,41.52 R40.1 R21.2 v1(30.58,38.51)
B: length 10
  Bottom Layer w0.381: J1.B 24.09,38.66 R23.2 20.52,38.67 U12.5
BEEP: length 59.2
  Top Layer w0.381: v1(52.27,36.66) 52.07,36.87 v1(52.07,53.24)
  Bottom Layer w0.381: U1.21 64.33,28.35 63.46,29.22 54.93,29.22 53.52,30.63 53.52,35.42 v1(52.27,36.66) ; R24.1 37.28,54.14 37.52,53.9 37.52,51.79 38.2,51.11 45.14,51.11 45.47,51.43 45.47,52.78 45.92,53.24 v1(52.07,53.24)
CTP_INT: length 5.8
  Bottom Layer w0.305: U1.8 52.77,16.52 51.54,17.75 FPC1.4
CTP_RST: length 6.1
  Bottom Layer w0.305: U1.7 53.33,15.25 51.33,17.25 FPC1.5
CTP_SCL: length 43.6
  Bottom Layer w0.305: U1.9 54.91,17.83 52.17,17.83 51.75,18.25 FPC1.3 40.22,18.25 39.57,18.9 39.57,44.25 38.94,44.88 R49.1
CTP_SDA: length 45.1
  Bottom Layer w0.305: U1.10 54.91,19.1 52.88,19.1 52.53,18.75 FPC1.2 40.48,18.75 40.13,19.1 40.13,46.13 39.47,46.79 37.42,46.79 R48.1
DMX_EN: length 23.2
  Top Layer w0.381: v1(69.39,26.77) 69.45,26.83 69.45,44.22 v1(69.12,44.55)
  Bottom Layer w0.381: U20.2 v1(69.12,44.55) ; v1(69.39,26.77) 69.41,26.75 U1.25
DMX_OE: length 27.6
  Top Layer w0.254: v1(59.26,39.93) 59.26,32.23 v1(59.69,31.8)
  Bottom Layer w0.254: v1(59.26,39.93) 59.26,40.28 58.6,40.94 U3.6 58.6,42.06 58.45,42.22 57.61,42.22 57.48,42.09 57.48,41.12 57.24,40.88 R16.1 ; v1(59.69,31.8) 60.15,31.34 66.12,31.34 68.14,29.32 U1.24
DMX_RX: length 21.3
  Top Layer w0.254: v1(58.09,39.37) 58.09,30.78 v1(58.5,30.38)
  Bottom Layer w0.254: v1(58.5,30.38) 58.94,29.94 64.32,29.94 65.6,28.66 U1.22 ; U3.4 58.09,39.37 v1(58.09,39.37)
DMX_TX: length 22.8
  Top Layer w0.254: v1(59.12,31.11) 58.67,31.55 58.67,39.85 v1(58.09,40.44)
  Bottom Layer w0.254: v1(59.12,31.11) 59.57,30.65 65.11,30.65 66.87,28.89 U1.23 ; U3.5 58.09,40.44 v1(58.09,40.44)
DN: length 8.9
  Top Layer w0.254: 5.67,27.75 5.66,27.74 4.44,27.74 4.32,27.86 4.32,28.6 4.47,28.75 8.99,28.75 9.25,29.01 9.58,29.01 v1(9.59,29.02)
  Bottom Layer w0.381: v1(9.59,29.02) 10.76,29.02 ; 10.76,29.02 10.81,28.97 ; 10.76,29.02 10.79,29.02
DP: length 8.1
  Top Layer w0.254: 8.11,27.25 7.11,28.25 5.67,28.25 ; 8.11,27.25 9.04,27.25 9.22,27.08 v1(9.58,27.08) ; 8.11,27.25 5.67,27.25
  Bottom Layer w0.381: 10.81,27.11 10.78,27.08 v1(9.58,27.08)
EN: length 120
  Top Layer w0.381: v1(63.96,11.85) 63.96,50.22 U6.2 ; v1(13.41,46.33) 5.42,46.33 SW1.1
  Bottom Layer w0.381: R1.1 C12.2 12,46.33 v1(13.41,46.33) 13.41,49.02 14.81,50.42 45.76,50.42 46.28,50.93 46.28,52.05 46.7,52.47 63.51,52.47 63.95,52.03 63.95,50.28 U6.2 ; v1(63.96,11.85) 58.61,11.85 56.93,10.17 U1.3
ENCODER_A: length 46.8
  Bottom Layer w0.381: U1.6 53.15,13.98 51.92,12.75 37.03,12.75 36.37,13.41 36.37,36.03 35.74,36.67 33.68,36.67 33.67,36.66 ; 33.65,38.46 33.67,38.43 33.67,36.66 ; 33.67,36.66 C20.2
ENCODER_B: length 57.1
  Bottom Layer w0.254: R23.1 C22.2
  Bottom Layer w0.381: C22.2 18.54,34.96 19.05,34.44 23.52,34.44 26.22,31.74 28.38,31.74 32.06,28.07 32.06,26.87 34.9,24.03 34.9,12.9 36.36,11.44 U1.4
ENCODER_KEY: length 46.4
  Bottom Layer w0.381: U1.5 53.3,12.71 52.73,12.14 36.63,12.14 35.64,13.13 35.64,24.33 33.07,26.9 33.07,28.96 33.58,29.46 35.2,29.46 35.56,29.82 35.56,32.51 35.29,32.78 R22.2 C21.2
IO0: length 43.6
  Top Layer w0.381: v1(72.44,25.7) 72.44,49.63 71.73,50.34 66.62,50.34 U6.1
  Bottom Layer w0.381: U1.27 72.45,25.7 v1(72.44,25.7) ; R2.1 57.9,47.36 59.26,48.72 66.14,48.72 66.49,49.06 66.49,50.22
KEY: length 24.5
  Top Layer w0.381: J1.N0 27.13,28.07 v1(27.13,32.78)
  Bottom Layer w0.381: U12.3 27.13,41.61 v1(27.13,32.78) 31.67,32.78 31.67,30.85
LCD_A: length 14.5
  Bottom Layer w0.305: U21.9 44.92,26.25 44.5,26.67 44.5,35.78 R53.1
LCD_BL: length 21.3
  Bottom Layer w0.305: U1.20 63.06,27.79 62.24,28.61 54.55,28.61 52.83,30.33 52.83,34.95 51.97,35.81 R45.1
LCD_CS: length 11.4
  Bottom Layer w0.305: U21.5 52.62,28.25 53.95,26.93 58.87,26.93 59.25,26.54 U1.17
LCD_RS: length 11.4
  Bottom Layer w0.305: U21.7 49.71,27.24 52.11,27.24 53.03,26.31 53.03,20.63 53.34,20.33 54.95,20.33
LCD_RST: length 10.5
  Bottom Layer w0.305: U1.12 53.85,21.6 53.54,21.9 53.54,26.58 52.38,27.75 U21.6
LCD_SCL: length 13.1
  Bottom Layer w0.305: U1.18 60.52,26.91 59.94,27.49 54.15,27.49 52.89,28.75 U21.4
LCD_SDA: length 15.1
  Bottom Layer w0.305: U21.2 52.65,29.75 54.35,28.05 61.12,28.05 61.82,27.34 61.82,25.45 U1.19
LED2: length 10.8
  Bottom Layer w0.381: U1.39 72.47,8.87 R8.2
LED3: length 45.7
  Top Layer w0.381: v1(70.79,49.02) 70.79,19.06 v1(70.79,19.06)
  Bottom Layer w0.381: v1(70.79,49.02) 74.17,49.02 75.74,47.45 84.11,47.45 R7.2 ; U1.31 v1(70.79,19.06)
RXD0: length 47
  Top Layer w0.381: v1(61.47,19.81) 61.47,50.22 U6.3
  Bottom Layer w0.381: U1.36 69.16,12.71 68.45,13.41 68.45,17.86 66.5,19.81 v1(61.47,19.81)
RZ_CLK: length 8.5
  Bottom Layer w0.381: U19.2 74.68,24.07 74.29,23.69 74.29,18.77 73.31,17.79 U1.32
RZ_DATA: length 3.4
  Bottom Layer w0.381: U1.33 73.67,16.52 74.39,17.24 U18.2
RZ_OE: length 19.8
  Bottom Layer w0.254: 74.42,11.73 74.42,16.05 74.66,16.29 U18.1 75.52,16.31 76.3,16.31 76.56,16.56 76.56,18.64 76.3,18.9 75.24,18.9 74.78,19.36 74.78,21.89 75.5,22.62 U19.1 ; 74.42,11.73 76.06,11.73 R14.1 ; 74.42,11.73 74.42,10.67 73.92,10.17 U1.38
TXD0: length 49.6
  Top Layer w0.381: v1(60.78,18.8) 60.78,46.36 58.87,48.27 58.87,50.21 U6.4
  Bottom Layer w0.381: v1(60.78,18.8) 66.09,18.8 67.41,17.47 67.41,12.9 68.88,11.44 U1.37
USB_DN: length 89.8
  Top Layer w0.381: v1(56.29,22.86) 50.7,22.86 49.43,24.13 v1(44.78,24.13)
  Bottom Layer w0.381: D2.1 D2.6 14.14,29.35 13.76,28.97 R20.2 ; 14.14,36.81 14.14,48.68 15.24,49.78 39.93,49.78 41.35,48.36 41.35,24.64 41.86,24.13 44.73,24.13 ; U1.13 56.28,22.87 v1(56.29,22.86)
USB_DP: length 95
  Top Layer w0.381: v1(56.24,24.13) 57.23,24.13 57.56,23.8 57.56,22.17 57.12,21.74 50.06,21.74 48.9,22.91 v1(44.81,22.91)
  Bottom Layer w0.381: v1(56.24,24.13) 56.23,24.14 U1.14 ; v1(44.81,22.91) 41.1,22.91 40.69,23.32 40.69,47.95 39.57,49.07 16.81,49.07 16.04,48.3 16.04,42.55 16.02,42.54 16.02,36.83 D2.3 D2.4 16,34.48 16,32.92 14.78,31.7 14.78,27.9 14,27.11 13.17,27.11
$1N288: length 15
  Bottom Layer w0.381: 63.78,39.02 63.78,35.28 63.5,35 R15.1 ; 63.78,39.02 63.78,40.32 ; 63.78,39.02 63.75,39.05 U2.2 ; 63.78,40.32 63.78,43.38 63.56,43.6 U20.4 ; 63.78,40.32 U2.3
$1N299: length 2.1
  Bottom Layer w0.381: 77.7,18.19 77.73,18.16 79.75,18.16
$1N306: length 2.7
  Bottom Layer w0.254: U3.1 59.62,37.95 59.77,37.8 61.89,37.8 U2.1
$1N311: length 3.1
  Bottom Layer w0.254: U3.8 59.62,41.89 59.78,42.05 60.12,42.05 60.58,41.59 U2.4
$1N321: length 6
  Bottom Layer w0.381: R11.1 81.98,18.19 81.98,20.62 ; R11.1 83.64,18.16 84.76,19.28 CN1.2 ; R11.1 81.75,18.16
$1N328: length 2.1
  Bottom Layer w0.381: 79.75,25.02 79.75,25.02 77.7,25.02
$1N333: length 5.8
  Bottom Layer w0.381: CN1.3 84.74,24.38 83.93,24.38 83.28,25.02 R13.1 ; R13.1 81.75,25.02 ; R13.1 81.98,24.99 D1.1
$1N357: length 2.4
  Bottom Layer w0.381: U2.7 68.22,39.05 68.5,38.76 69.33,38.76
$1N358: length 2.5
  Bottom Layer w0.381: U2.6 68.05,40.32 68.49,40.75 R9.2
$1N435: length 3.3
  Bottom Layer w0.381: R6.1 8.01,39.11 4.77,39.11
$1N437: length 3.5
  Bottom Layer w0.889: F1.1 11.84,20.96 D8.2
$1N442: length 2.1
  Bottom Layer w0.381: 71.33,38.76 71.43,38.86 72.11,38.86 72.53,39.28 L1.1
$1N443: length 2.2
  Bottom Layer w0.381: L1.2 72.72,40.08 72.05,40.75 R9.1
$1N447: length 4.9
  Bottom Layer w0.381: LED2.1 88.26,6.81 85.58,6.81 85.2,7.19 R8.1
$1N449: length 6.5
  Bottom Layer w0.381: R7.1 85.97,49.51 86.16,49.33 86.16,47.3 86.78,46.67 LED3.1
$1N474: length 12.5
  Bottom Layer w0.381: CN2.2 83.27,36.82 81.74,38.36 U14.2 80.48,38.51 78.89,38.51 78.77,38.63 R12.2 75.61,38.63 ; 75.61,38.63 75.61,39.01 75.34,39.28 L1.4 ; 75.61,38.63 75.61,37.38 75.6,37.37 R17.1
$1N476: length 12.7
  Bottom Layer w0.381: L1.3 75.02,40.06 75.04,40.08 75.46,40.08 75.69,40.3 75.69,40.46 ; 75.6,42.42 75.69,42.42 75.69,40.46 ; 75.69,40.46 75.72,40.49 77.48,40.49 R12.1 78.68,40.63 78.9,40.85 U13.2 82.07,40.85 83.13,41.9 CN2.3
$1N486: length 5.5
  Top Layer w0.254: 5.67,26.25 v1(9.07,26.25)
  Bottom Layer w0.381: 9.08,26.25 10.08,25.25 10.81,25.25
$1N487: length 5.8
  Top Layer w0.305: v1(9.09,29.92) 8.42,29.25 5.67,29.25
  Bottom Layer w0.381: 9,29.92 9.05,29.97 ; R4.1 10.01,30.84 v1(9.09,29.92)
$1N493: length 10.9
  Bottom Layer w0.381: U1.26 70.68,27.92 67.51,31.09 67.51,34.96 R51.2
$1N494: length 11.7
  Top Layer w0.381: v1(57.66,29.97) 58.37,29.26 v1(58.37,23.32)
  Bottom Layer w0.381: U1.16 57.98,23.7 v1(58.37,23.32) ; v1(57.66,29.97) 56.49,29.97 56.24,30.23 56.24,31.14 R50.2
$2N13: length 6.6
  Bottom Layer w0.381: Q4.4 15.34,7.06 13.87,5.59 12.97,5.59 D9.2 12.94,3.67 13.11,3.5 13.98,3.5 R39.2
$2N41: length 18.3
  Bottom Layer w0.889: C28.2 33.68,10.22 32.84,11.06 32.84,15.37 31.95,16.26 27.65,16.26 27.65,16.26 ; 33.12,7.75 33.06,7.81 28.35,7.81
$2N58: length 3.4
  Bottom Layer w0.381: Q5.3 29.1,53.14 28.14,53.14 27.39,53.89 U10.2
$2N72: length 1.8
  Bottom Layer w0.381: Q5.1 31.14,54.1 32.85,54.1 R24.2
$2N73: length 1.8
  Bottom Layer w0.381: Q5.2 32.86,52.22 R44.2
$2N112: length 2.5
  Bottom Layer w0.381: Q6.3 46.16,37.51 46.48,37.19 46.48,35.83 R53.2
$2N131: length 7
  Bottom Layer w0.381: Q6.1 44.57,38.75 44.86,38.46 R52.1 48.07,35.86 R45.2

## Copper pours and planes (outline as drawn; the poured copper is in the pictures)
GND on Top Layer: 0,56.01 93.02,56.01 93.02,0 0,0
GND on Bottom Layer: -0.04,56.01 93.02,56.01 93.02,0 -0.04,0
VBUS on Top Layer: 5.94,25.09 5.94,30.94 8.79,30.94 8.79,29.92 8.78,29.91 8.76,29.92 7.33,29.92 7.33,26.21 8.78,26.21 8.78,25.09
VBUS on Bottom Layer: 6.25,30.89 8.69,30.89 8.69,25.07 8.66,25.04 9.6,25.04 9.6,23.17 6.25,23.17
$2N66 on Bottom Layer: 15.8,7.98 23.98,7.98 23.98,4.99 15.8,4.99
$2N68 on Bottom Layer: 14.69,13.19 17.82,13.19 17.82,8.41 14.69,8.41

## Text on the board
Bottom Silkscreen Layer: C | D | GND | B | A | RDM/DMX | RZ_CODE
Top Silkscreen Layer: 3V3 | GND | TX0 | RX0 | EN | IO0 | RESET | PWR | RDM/DMX | RZ_CODE | ESP-DMX-RDM-RZ / PixelBridge v1.2 | F111 Studio
